# Altium schematic sheet BUCK_Switching_Converter.SchDoc
size B; SheetNumber: 1; SheetTotal: 1
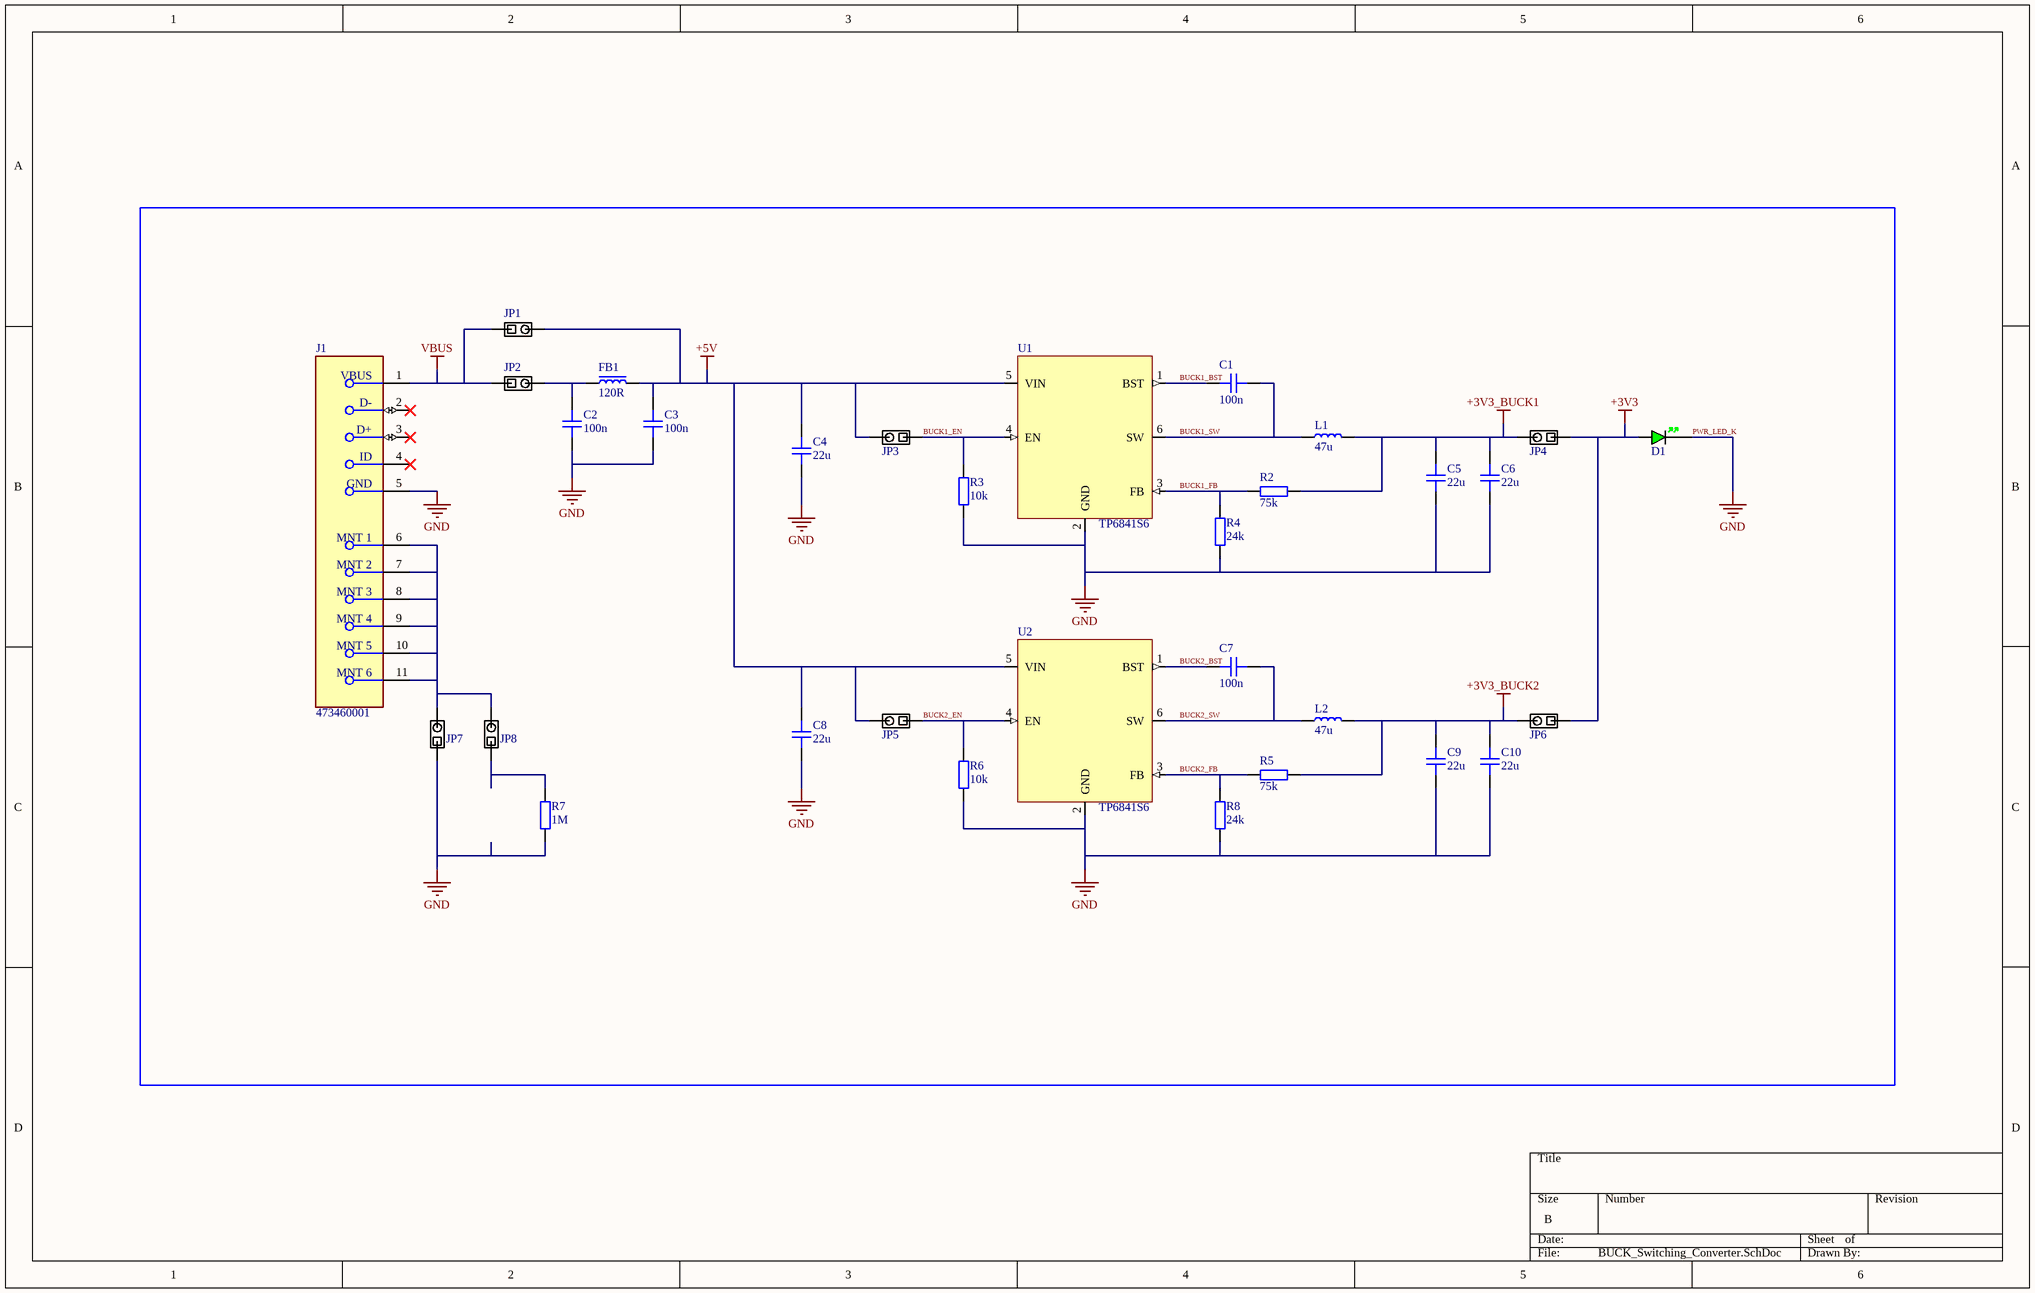
[diagram p0: BUCK_Switching_Converter.SchDoc]

## Parts
C1  100n  [FP-C0603X104K5RAC3316-IPC_A]
C2  100n  [FP-C0603X104K5RAC3316-IPC_A]
C3  100n  [FP-C0603X104K5RAC3316-IPC_A]
C4  22u  [G-32_MUR]
C5  22u  [G-32_MUR]
C6  22u  [G-32_MUR]
C7  100n  [FP-C0603X104K5RAC3316-IPC_A]
C8  22u  [G-32_MUR]
C9  22u  [G-32_MUR]
C10  22u  [G-32_MUR]
D1  GREEN  [LED_SM0603UYC]  (value not drawn)
FB1  120R  [IND_BLM18_0603_MUR]
J1  473460001  [FP-473460001-MFG]
JP1  Solder Jumper  [FCI_68786-202LF]  (value not drawn)
JP2  Solder Jumper  [FCI_68786-202LF]  (value not drawn)
JP3  Solder Jumper  [FCI_68786-202LF]  (value not drawn)
JP4  Solder Jumper  [FCI_68786-202LF]  (value not drawn)
JP5  Solder Jumper  [FCI_68786-202LF]  (value not drawn)
JP6  Solder Jumper  [FCI_68786-202LF]  (value not drawn)
JP7  Solder Jumper  [FCI_68786-202LF]  (value not drawn)
JP8  Solder Jumper  [FCI_68786-202LF]  (value not drawn)
L1  47u  [INDM7066X300N]
L2  47u  [INDM7066X300N]
R2  75k  [RC0603N_YAG]
R3  10k  [RC0603N_YAG]
R4  24k  [RC0603N_YAG]
R5  75k  [RC0603N_YAG]
R6  10k  [RC0603N_YAG]
R7  1M  [RC0603N_YAG]
R8  24k  [RC0603N_YAG]
U1  TP6841S6  [SOT95P280X125-6N]
U2  TP6841S6  [SOT95P280X125-6N]

## Nets
+3V3: D1.A JP4.1 JP6.1
+3V3_BUCK1: C5.2 C6.2 JP4.2 L1.2 R2.1
+3V3_BUCK2: C9.2 C10.2 JP6.2 L2.2 R5.1
+5V: C3.2 C4.2 C8.2 FB1.2 JP1.2 JP3.2 JP5.2 U1.5(VIN) U2.5(VIN)
PWR_LED_K: C2.1 C3.1 C4.1 C5.1 C6.1 C8.1 C9.1 C10.1 D1.K J1.5(GND) JP7.1 R3.1 R4.1 R6.1 R7.1 R8.1 U1.2(GND) U2.2(GND)  [also labelled GND]
VBUS: J1.1(VBUS) JP1.1 JP2.1
BUCK1_BST: C1.2 U1.1(BST)
BUCK1_EN: JP3.1 R3.2 U1.4(EN)
BUCK1_FB: R2.2 R4.2 U1.3(FB)
BUCK1_SW: C1.1 L1.1 U1.6(SW)
BUCK2_BST: C7.2 U2.1(BST)
BUCK2_EN: JP5.1 R6.2 U2.4(EN)
BUCK2_FB: R5.2 R8.2 U2.3(FB)
BUCK2_SW: C7.1 L2.1 U2.6(SW)
NetC2_2: C2.2 FB1.1 JP2.2
NetJ1_6: J1.6(MNT_1) J1.7(MNT_2) J1.8(MNT_3) J1.9(MNT_4) J1.10(MNT_5) J1.11(MNT_6) JP7.2 JP8.2
NetJP8_1: JP8.1 R7.2

Not connected (* = marked no-connect by the designer): J1 2(D-)* 3(D+)* 4(ID)*

## Library data of the parts
C1-C3 C7 = CAP_0603_50V: Capacitor SMD 0603 50V
C4-C6 C8-C10 = CAP_1210_10V: Capacitor SMD 1210 10V
D1 = LED_0402_GREEN: LED 0402 GREEN SMD
FB1 = FB_0603: Ferrite Bead SMD 0603
J1 = CMP-2000-05246-2: CONN RCPT USB2.0 MICRO B SMD R/A; Manufacturer: Molex; Conn Orientation: Right Angle; Is Female: yes; Shielding: true; Pitch: 0.65mm; Number Of Contacts: 5; Voltage Rating: 30V; Current Rating: 1.8A; Device Class L2: USB Connectors; Digikey Description: CONN RCPT USB2.0 MICRO B SMD R/A; Height: 2.945mm; RoHS: TRUE; ComponentLink2Description: Datasheet; Octopart: https://octopart.com/47346-0001-molex-7164928; Automotive: No; Package: 0; Category: Conn; Device Class L1: Connectors; Usb Standard: USB 2.0; Temperature: -30°C to +85°C; Temperature Range Low: -30°C; Footprint Url: https://www.molex.com/pdm_docs/sd/473460001_sd.pdf; ComponentLink2URL: https://www.molex.com/webdocs/datasheets/pdf/en-us/0473460001_IO_CONNECTORS.pdf; Lead Free: Yes; Manufacturer Part Number: 473460001; Contact Material: Gold,Nickel; Temperature Range High: +85°C; Device Class L3: unset
JP1-JP8 = SolderJumper_Single: Solder Jumper Single 0.5mm Pitch
L1 L2 = MWSA0603S: Power Inductor SMD Sunlord MWSA0603S; Manufacturer Part Number: MWSA0603S-; Manufacturer: Sunlord
R2-R8 = RES_0603: Resistor SMD 0603
U1 U2 = TP6841S6: 40V 0.8A 800kHz Synchronous Step-Down Converter; Manufacturer: TECH PUBLIC; Manufacturer Part Number: TP6841S6